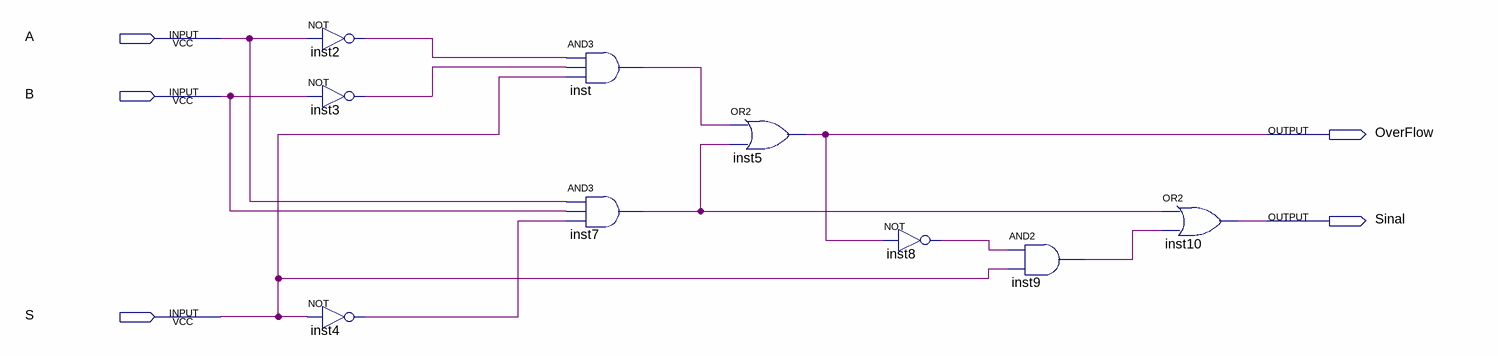
[diagram p0: schematic sheet]
// Quartus schematic OF_Signal_Soma.bdf as structural Verilog: 9 symbols, 5 pins
module OF_Signal_Soma (
  input  A,
  input  B,
  input  S,
  output OverFlow,
  output Sinal
);

  wire inst2_out, inst3_out, inst4_out, inst7_out, inst8_out, inst9_out, inst_out;

  not inst2 (inst2_out, A);
  not inst3 (inst3_out, B);
  not inst4 (inst4_out, S);
  and inst (inst_out, inst2_out, inst3_out, S);
  and inst7 (inst7_out, A, B, inst4_out);
  or inst5 (OverFlow, inst_out, inst7_out);
  not inst8 (inst8_out, OverFlow);
  and inst9 (inst9_out, inst8_out, S);
  or inst10 (Sinal, inst7_out, inst9_out);
endmodule
